# Altium schematic sheet DAUCAM.SchDoc
size A
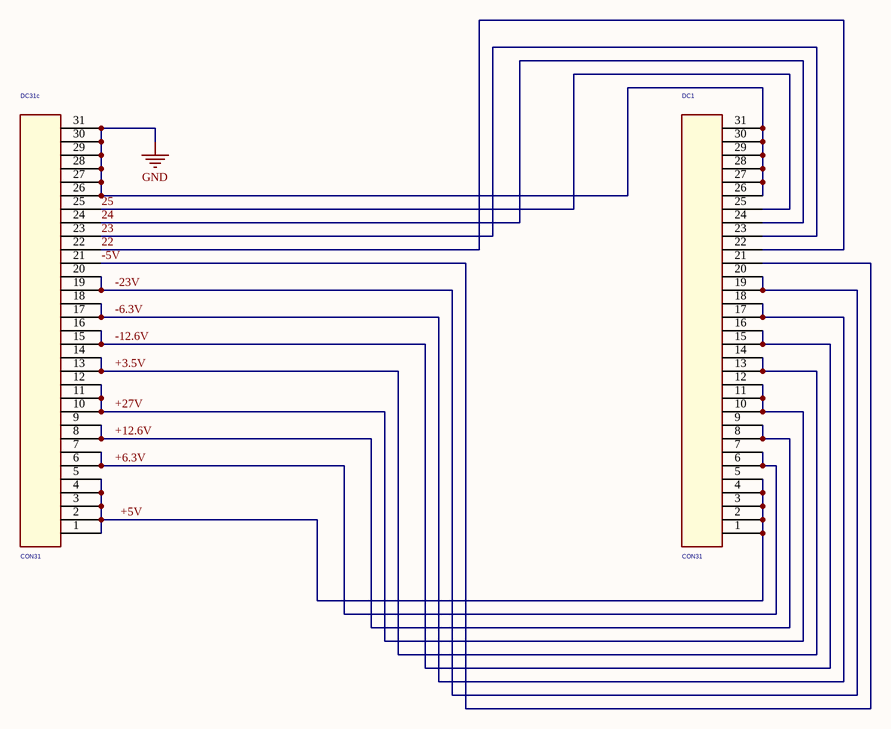
[diagram p0: DAUCAM.SchDoc]

## Parts
DC1  CON31  [dau_cam_31_chan_Nga]
DC31c  CON31  [dau_cam_31_chan_Nga]

## Nets
GND: DC1.26 DC1.27 DC1.28 DC1.29 DC1.30 DC1.31 DC31c.26 DC31c.27 DC31c.28 DC31c.29 DC31c.30 DC31c.31
22: DC1.22 DC31c.22
23: DC1.23 DC31c.23
24: DC1.24 DC31c.24
25: DC1.25 DC31c.25
+3.5V: DC1.13 DC1.14 DC31c.13 DC31c.14
+5V: DC1.1 DC1.2 DC1.3 DC1.4 DC1.5 DC31c.1 DC31c.2 DC31c.3 DC31c.4 DC31c.5
+6.3V: DC1.6 DC1.7 DC31c.6 DC31c.7
+12.6V: DC1.8 DC1.9 DC31c.8 DC31c.9
+27V: DC1.10 DC1.11 DC1.12 DC31c.10 DC31c.11 DC31c.12
-5V: DC1.21 DC31c.21
-6.3V: DC1.17 DC1.18 DC31c.17 DC31c.18
-12.6V: DC1.15 DC1.16 DC31c.15 DC31c.16
-23V: DC1.19 DC1.20 DC31c.19 DC31c.20